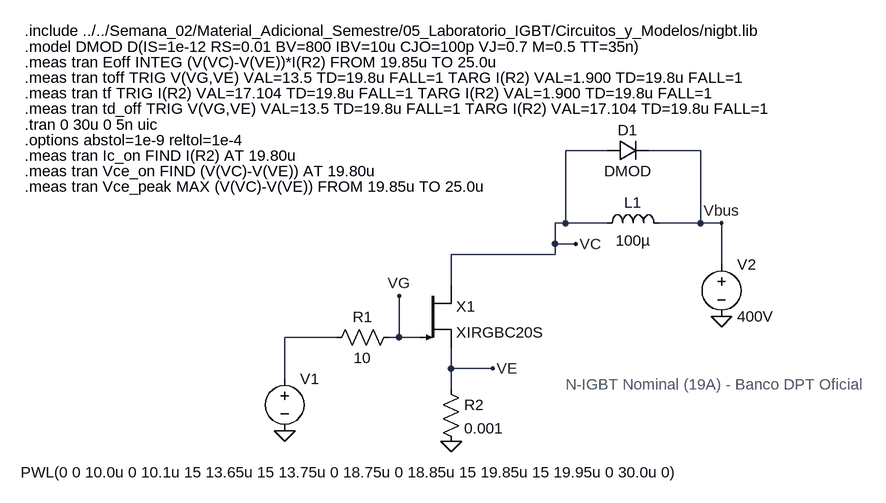
[diagram p0: schematic DPT_NIGBT_nom.asc]
DPT_NIGBT_nom.asc, the LTspice schematic file:
Version 4.1
SHEET 1 1224 680
WIRE 224 -320 160 -320
WIRE 368 -320 288 -320
WIRE 160 -208 160 -320
WIRE 160 -208 144 -208
WIRE 224 -208 160 -208
WIRE 368 -208 368 -320
WIRE 368 -208 304 -208
WIRE 400 -208 368 -208
WIRE 144 -176 144 -208
WIRE 176 -176 144 -176
WIRE 144 -160 144 -176
WIRE 144 -160 -16 -160
WIRE 400 -144 400 -208
WIRE -16 -112 -16 -160
WIRE -192 -32 -272 -32
WIRE -96 -32 -96 -96
WIRE -96 -32 -112 -32
WIRE -64 -32 -96 -32
WIRE -16 16 -16 -16
WIRE 48 16 -16 16
WIRE -272 32 -272 -32
WIRE -16 48 -16 16
FLAG -16 128 0
FLAG -272 112 0
FLAG 400 -64 0
FLAG -96 -96 VG
FLAG 48 16 VE
FLAG 176 -176 VC
FLAG 400 -208 Vbus
SYMBOL Misc\\NIGBT -64 -112 R0
SYMATTR InstName X1
SYMATTR Value XIRGBC20S
SYMATTR Prefix X
SYMBOL res -96 -48 R90
WINDOW 0 0 56 VBottom 2
WINDOW 3 32 56 VTop 2
SYMATTR InstName R1
SYMATTR Value 10
SYMBOL res -32 32 R0
SYMATTR InstName R2
SYMATTR Value 0.001
SYMBOL voltage -272 16 R0
WINDOW 3 -406 160 Left 2
SYMATTR Value PWL(0 0 10.0u 0 10.1u 15 13.65u 15 13.75u 0 18.75u 0 18.85u 15 19.85u 15 19.95u 0 30.0u 0)
SYMATTR InstName V1
SYMBOL voltage 400 -160 R0
WINDOW 123 0 0 Left 0
WINDOW 39 0 0 Left 0
SYMATTR InstName V2
SYMATTR Value 400V
SYMBOL ind 208 -192 R270
WINDOW 0 32 56 VTop 2
WINDOW 3 5 56 VBottom 2
SYMATTR InstName L1
SYMATTR Value 100µ
SYMATTR SpiceLine Rser=1m
SYMBOL diode 224 -304 R270
WINDOW 0 32 32 VTop 2
WINDOW 3 0 32 VBottom 2
SYMATTR InstName D1
SYMATTR Value DMOD
TEXT -672 -504 Left 2 !.include ../../Semana_02/Material_Adicional_Semestre/05_Laboratorio_IGBT/Circuitos_y_Modelos/nigbt.lib
TEXT -672 -480 Left 2 !.model DMOD D(IS=1e-12 RS=0.01 BV=800 IBV=10u CJO=100p VJ=0.7 M=0.5 TT=35n)
TEXT -672 -360 Left 2 !.tran 0 30u 0 5n uic
TEXT -672 -336 Left 2 !.options abstol=1e-9 reltol=1e-4
TEXT -672 -312 Left 2 !.meas tran Ic_on FIND I(R2) AT 19.80u
TEXT -672 -288 Left 2 !.meas tran Vce_on FIND (V(VC)-V(VE)) AT 19.80u
TEXT -672 -264 Left 2 !.meas tran Vce_peak MAX (V(VC)-V(VE)) FROM 19.85u TO 25.0u
TEXT -672 -384 Left 2 !.meas tran td_off TRIG V(VG,VE) VAL=13.5 TD=19.8u FALL=1 TARG I(R2) VAL=17.104 TD=19.8u FALL=1
TEXT -672 -408 Left 2 !.meas tran tf TRIG I(R2) VAL=17.104 TD=19.8u FALL=1 TARG I(R2) VAL=1.900 TD=19.8u FALL=1
TEXT -672 -432 Left 2 !.meas tran toff TRIG V(VG,VE) VAL=13.5 TD=19.8u FALL=1 TARG I(R2) VAL=1.900 TD=19.8u FALL=1
TEXT -672 -456 Left 2 !.meas tran Eoff INTEG (V(VC)-V(VE))*I(R2) FROM 19.85u TO 25.0u
TEXT 160 40 Left 2 ;N-IGBT Nominal (19A) - Banco DPT Oficial

The netlist it stands for:
* DPT_NIGBT_nom.asc
X§X1 VC VG VE XIRGBC20S  ; pins C G E
R1 VG N001 10
R2 VE 0 0.001
V1 N001 0 PWL(0 0 10.0u 0 10.1u 15 13.65u 15 13.75u 0 18.75u 0 18.85u 15 19.85u 15 19.95u 0 30.0u 0)
V2 Vbus 0 400V
L1 VC Vbus 100µ Rser=1m
D1 VC Vbus DMOD
.model D D
.lib standard.dio
.include ../../Semana_02/Material_Adicional_Semestre/05_Laboratorio_IGBT/Circuitos_y_Modelos/nigbt.lib
.model DMOD D(IS=1e-12 RS=0.01 BV=800 IBV=10u CJO=100p VJ=0.7 M=0.5 TT=35n)
.tran 0 30u 0 5n uic
.options abstol=1e-9 reltol=1e-4
.meas tran Ic_on FIND I(R2) AT 19.80u
.meas tran Vce_on FIND (V(VC)-V(VE)) AT 19.80u
.meas tran Vce_peak MAX (V(VC)-V(VE)) FROM 19.85u TO 25.0u
.meas tran td_off TRIG V(VG,VE) VAL=13.5 TD=19.8u FALL=1 TARG I(R2) VAL=17.104 TD=19.8u FALL=1
.meas tran tf TRIG I(R2) VAL=17.104 TD=19.8u FALL=1 TARG I(R2) VAL=1.900 TD=19.8u FALL=1
.meas tran toff TRIG V(VG,VE) VAL=13.5 TD=19.8u FALL=1 TARG I(R2) VAL=1.900 TD=19.8u FALL=1
.meas tran Eoff INTEG (V(VC)-V(VE))*I(R2) FROM 19.85u TO 25.0u
* N-IGBT Nominal (19A) - Banco DPT Oficial
.backanno
.end